# Altium schematic sheet a0206-2006.10.SchDoc
size 558 x 431 mm
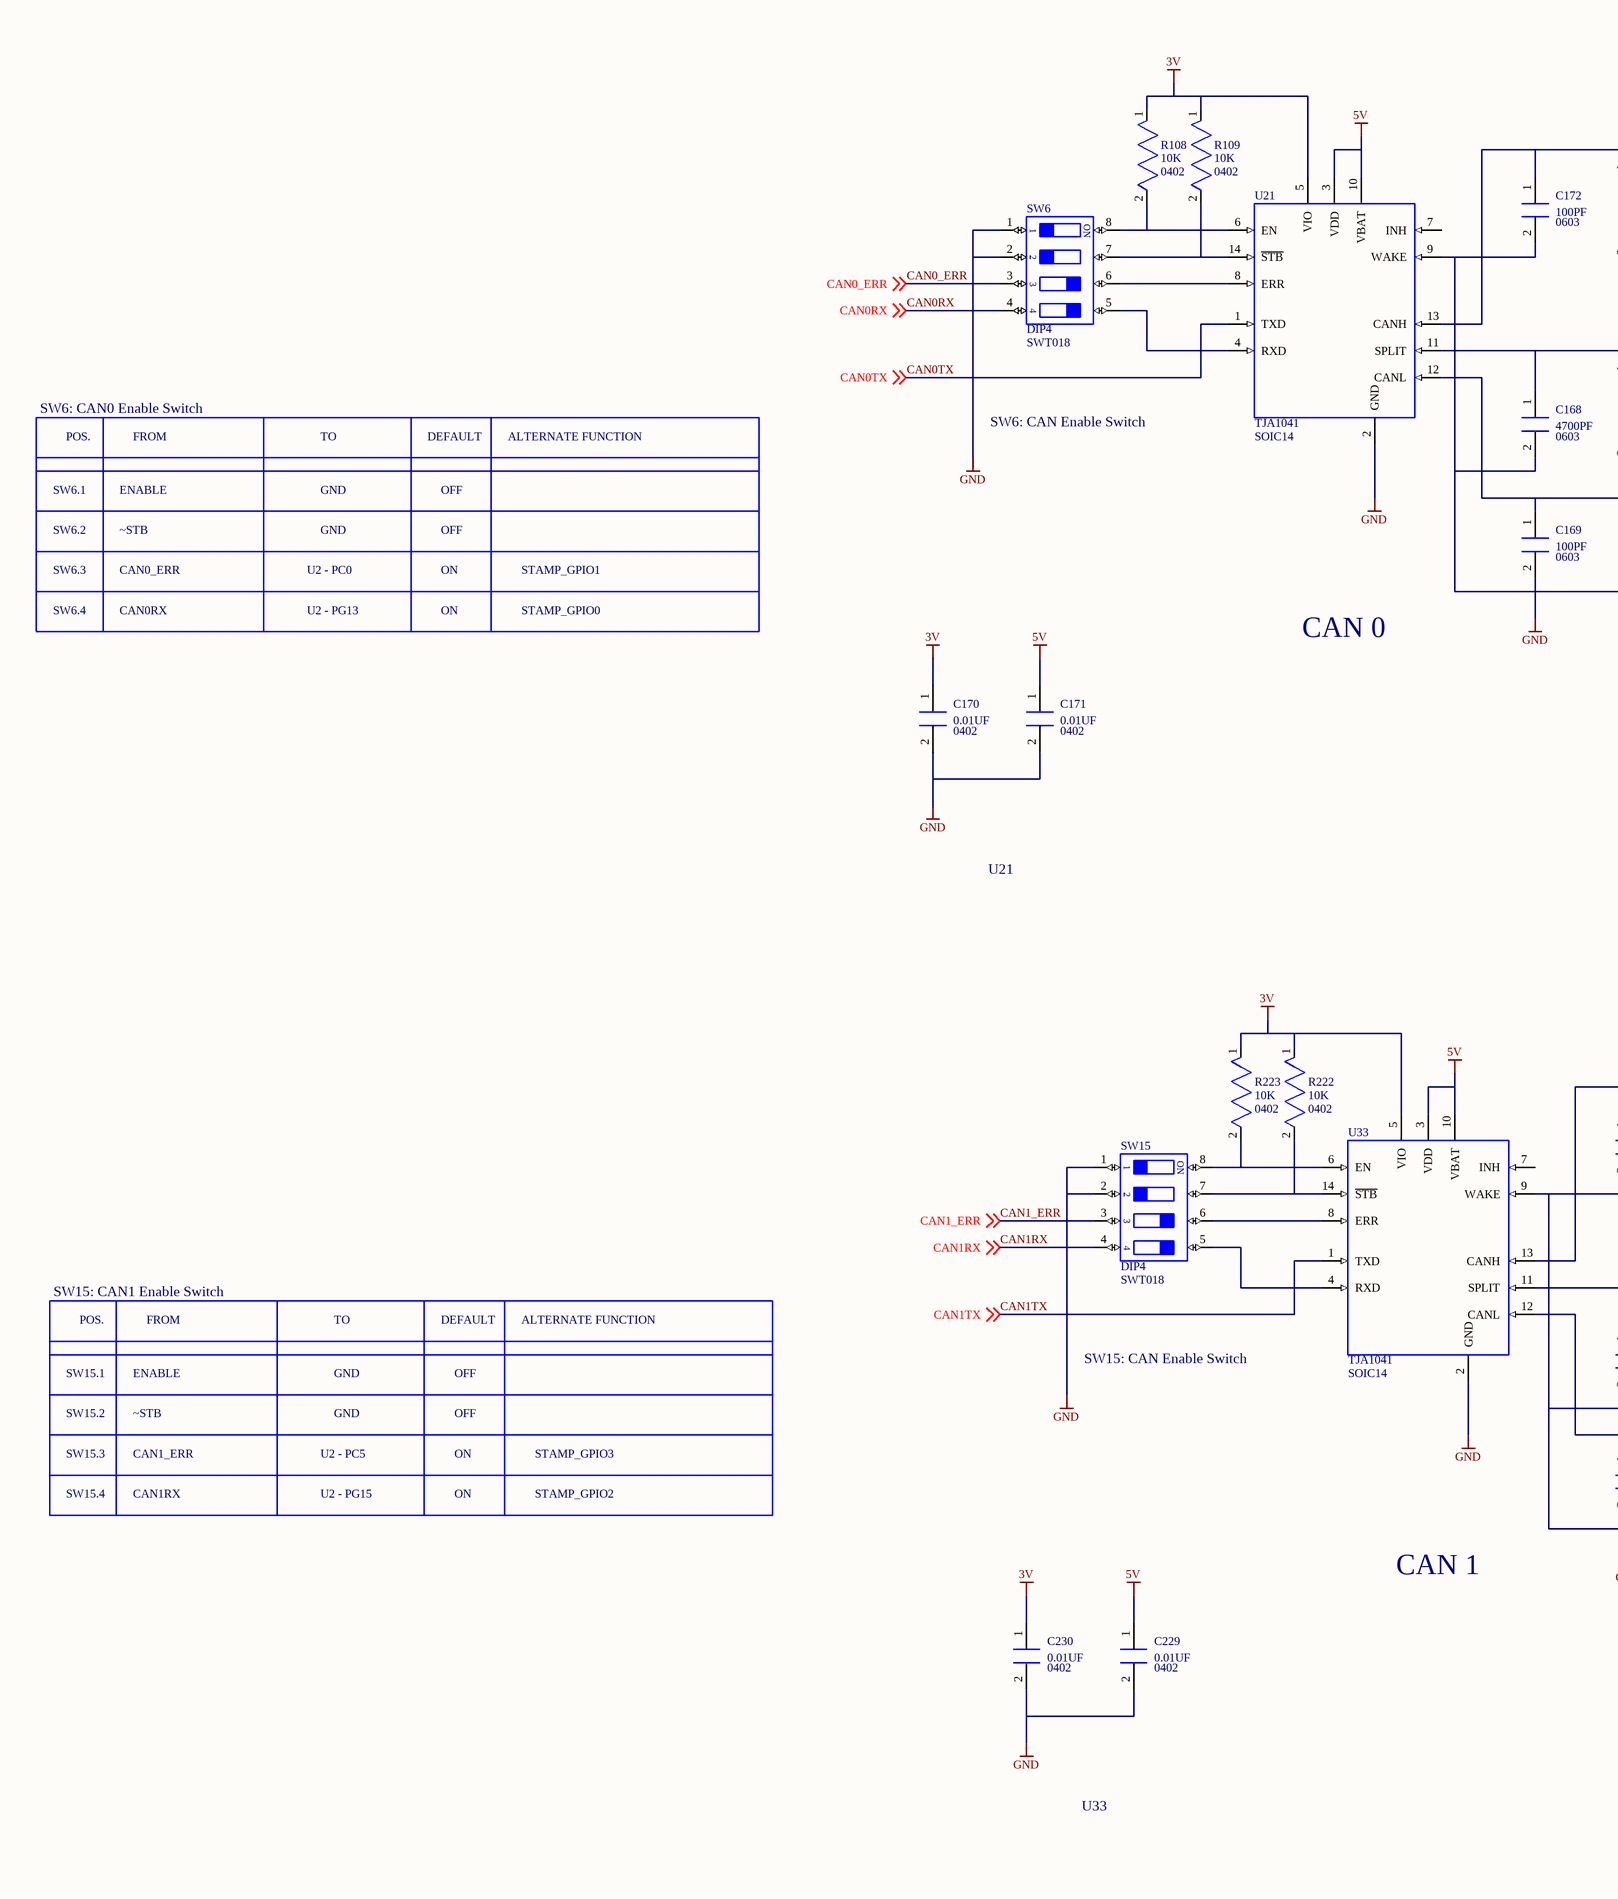
[diagram p0: a0206-2006.10.SchDoc, left]
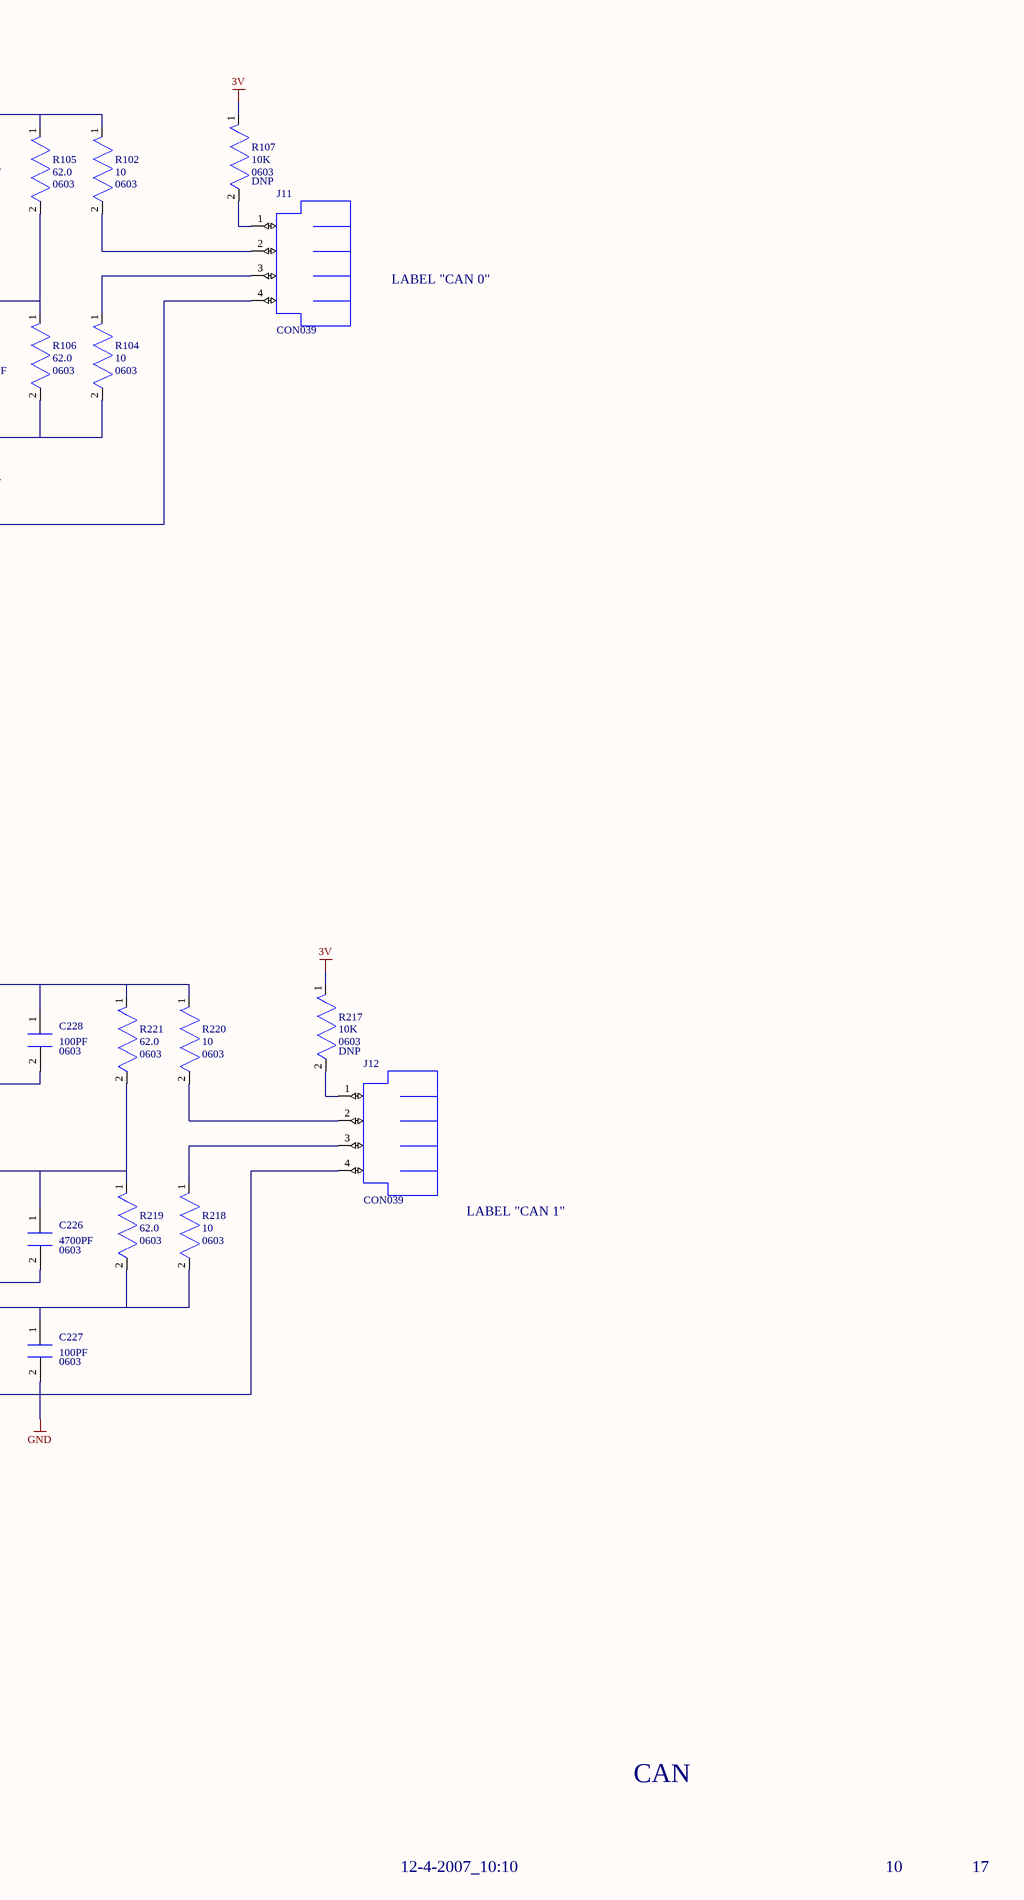
[diagram p1: a0206-2006.10.SchDoc, right]

## Parts
C168  value 4700PF  [0603]  (hidden comment: *)
C169  value 100PF  [0603]  (hidden comment: *)
C170  value 0.01UF  [0402]  (hidden comment: *)
C171  value 0.01UF  [0402]  (hidden comment: *)
C172  value 100PF  [0603]  (hidden comment: *)
C226  value 4700PF  [0603]  (hidden comment: *)
C227  value 100PF  [0603]  (hidden comment: *)
C228  value 100PF  [0603]  (hidden comment: *)
C229  value 0.01UF  [0402]  (hidden comment: *)
C230  value 0.01UF  [0402]  (hidden comment: *)
J11  *  [CON039]  (value not drawn)
J12  *  [CON039]  (value not drawn)
R102  value 10  [0603]  (hidden comment: *)
R104  value 10  [0603]  (hidden comment: *)
R105  value 62.0  [0603]  (hidden comment: *)
R106  value 62.0  [0603]  (hidden comment: *)
R107  value 10K  CLASS: DNP  [0603]  (hidden comment: *)
R108  value 10K  [0402]  (hidden comment: *)
R109  value 10K  [0402]  (hidden comment: *)
R217  value 10K  CLASS: DNP  [0603]  (hidden comment: *)
R218  value 10  [0603]  (hidden comment: *)
R219  value 62.0  [0603]  (hidden comment: *)
R220  value 10  [0603]  (hidden comment: *)
R221  value 62.0  [0603]  (hidden comment: *)
R222  value 10K  [0402]  (hidden comment: *)
R223  value 10K  [0402]  (hidden comment: *)
SW6  value DIP4  [SWT018]  (hidden comment: *)
SW15  value DIP4  [SWT018]  (hidden comment: *)
U21  PART: TJA1041  [SOIC14]  (hidden comment: *)
U33  PART: TJA1041  [SOIC14]  (hidden comment: *)

## Nets
3V: C170.1(A) C230.1(A) R107.1(N1) R108.1(N1) R109.1(N1) R217.1(N1) R222.1(N1) R223.1(N1) U21.5(VIO) U33.5(VIO)
5V: C171.1(A) C229.1(A) U21.3(VDD) U21.10(VBAT) U33.3(VDD) U33.10(VBAT)
GND: C168.2(B) C169.2(B) C170.2(B) C171.2(B) C172.2(B) C226.2(B) C227.2(B) C228.2(B) C229.2(B) C230.2(B) J11.4 J12.4 SW6.1 SW6.2 SW15.1 SW15.2 U21.2(GND) U21.9(WAKE) U33.2(GND) U33.9(WAKE)
CAN0_ERR: SW6.3 ; off-sheet CAN0_ERR
CAN0RX: SW6.4 ; off-sheet CAN0RX
CAN0TX: U21.1(TXD) ; off-sheet CAN0TX
CAN1_ERR: SW15.3 ; off-sheet CAN1_ERR
CAN1RX: SW15.4 ; off-sheet CAN1RX
CAN1TX: U33.1(TXD) ; off-sheet CAN1TX
NetC168_1: C168.1(A) R105.2(N2) R106.1(N1) U21.11(SPLIT)
NetC169_1: C169.1(A) R104.2(N2) R106.2(N2) U21.12(CANL)
NetC172_1: C172.1(A) R102.1(N1) R105.1(N1) U21.13(CANH)
NetC226_1: C226.1(A) R219.1(N1) R221.2(N2) U33.11(SPLIT)
NetC227_1: C227.1(A) R218.2(N2) R219.2(N2) U33.12(CANL)
NetC228_1: C228.1(A) R220.1(N1) R221.1(N1) U33.13(CANH)
NetJ11_1: J11.1 R107.2(N2)
NetJ11_2: J11.2 R102.2(N2)
NetJ11_3: J11.3 R104.1(N1)
NetJ12_1: J12.1 R217.2(N2)
NetJ12_2: J12.2 R220.2(N2)
NetJ12_3: J12.3 R218.1(N1)
NetR108_2: R108.2(N2) SW6.8 U21.6(EN)
NetR109_2: R109.2(N2) SW6.7 U21.14(~{STB})
NetR222_2: R222.2(N2) SW15.7 U33.14(~{STB})
NetR223_2: R223.2(N2) SW15.8 U33.6(EN)
NetSW6_5: SW6.5 U21.4(RXD)
NetSW6_6: SW6.6 U21.8(ERR)
NetSW15_5: SW15.5 U33.4(RXD)
NetSW15_6: SW15.6 U33.8(ERR)

Not connected (* = marked no-connect by the designer): U21 7(INH); U33 7(INH)

## Notes on the sheet
- LABEL "CAN 0"
- SW6: CAN0 Enable Switch
- POS.
- FROM
- TO
- DEFAULT
- ALTERNATE FUNCTION
- SW6: CAN Enable Switch
- SW6.1
- ENABLE
- GND
- OFF
- SW6.2
- SW6.3
- ~STB
- CAN0_ERR
- U2 - PC0
- ON
- STAMP_GPIO1
- SW6.4
- CAN0RX
- U2 - PG13
- STAMP_GPIO0
- CAN 0
- U21
- SW15: CAN1 Enable Switch
- SW15.1
- SW15: CAN Enable Switch
- LABEL "CAN 1"
- SW15.2
- SW15.3
- CAN1_ERR
- U2 - PC5
- STAMP_GPIO3
- SW15.4
- CAN1RX
- U2 - PG15
- STAMP_GPIO2
- CAN 1
- U33
- CAN
- 12-4-2007_10:10
- 10
- 17
- A
- B
- C
- D
- 1
- 2
- 3
- 20 Cotton Road
- 4
- DEVICES
- ANALOG
- Nashua, NH 03063
- PH: 1-800-ANALOGD
- Title
- ADSP-BF548 EZ-KIT LITE
- Size
- Board No.
- A0206-2006
- Rev
- 1.4B
- Date
- Sheet
- of
- (in symbol SW_DIP4.1) ON

## Library data of the parts
C168 = CAP_NON_POLARIZED.2: PART_SPEC: CAPACITOR; LEVEL: STD; TYPE: X7R; PRT_NUM: 7000387; BOARDS: BOTH; VOLTAGE: 16V; TOLERANCE: 10%; PKG_TYPE: 0603; ROHS: ROHS
C169 C172 = CAP_NON_POLARIZED.2: PART_SPEC: CAPACITOR; LEVEL: STD; TYPE: NPO; BOARDS: BOTH; TOLERANCE: 5%; VOLTAGE: 50V; PRT_NUM: 7000405; PKG_TYPE: 0603; ROHS: ROHS
C170 = CAP_NON_POLARIZED.2: PART_SPEC: CAPACITOR; LEVEL: STD; TYPE: X7R; BOARDS: BOTH; PRT_NUM: 7000279; VOLTAGE: 16V; TOLERANCE: 10%; PKG_TYPE: 0402; ROHS: ROHS
C171 = CAP_NON_POLARIZED.2: PART_SPEC: CAPACITOR; LEVEL: STD; TYPE: X7R; BOARDS: BOTH; TOLERANCE: 10%; VOLTAGE: 16V; PRT_NUM: 7000279; PKG_TYPE: 0402; ROHS: ROHS
C226 = CAP_NON_POLARIZED.2: PART_SPEC: CAPACITOR; LEVEL: STD; TOLERANCE: 10%; VOLTAGE: 16V; BOARDS: BOTH; PRT_NUM: 7000387; TYPE: X7R; PKG_TYPE: 0603; ROHS: ROHS
C227 C228 = CAP_NON_POLARIZED.2: PART_SPEC: CAPACITOR; LEVEL: STD; PRT_NUM: 7000405; VOLTAGE: 50V; TOLERANCE: 5%; BOARDS: BOTH; TYPE: NPO; PKG_TYPE: 0603; ROHS: ROHS
C229 = CAP_NON_POLARIZED.2: PART_SPEC: CAPACITOR; LEVEL: STD; PRT_NUM: 7000279; VOLTAGE: 16V; TOLERANCE: 10%; BOARDS: BOTH; TYPE: X7R; PKG_TYPE: 0402; ROHS: ROHS
C230 = CAP_NON_POLARIZED.2: PART_SPEC: CAPACITOR; LEVEL: STD; TOLERANCE: 10%; VOLTAGE: 16V; PRT_NUM: 7000279; BOARDS: BOTH; TYPE: X7R; PKG_TYPE: 0402; ROHS: ROHS
J11 = CON_RJ10.1: VERTICAL; LEVEL: STD; CONFIGURATION: 4PIN; PRT_NUM: 6000762; BOARDS: BOTH; TYPE: RJ11; PKG_TYPE: CON039; ROHS: ROHS
J12 = CON_RJ10.1: VERTICAL; LEVEL: STD; BOARDS: BOTH; PRT_NUM: 6000762; CONFIGURATION: 4PIN; TYPE: RJ11; PKG_TYPE: CON039; ROHS: ROHS
R102 = RES_STANDARD.2: PART_SPEC: RESISTOR; LEVEL: STD; POWER: 1/10W; BOARDS: BOTH; TOLERANCE: 5%; PRT_NUM: 7000374; PKG_TYPE: 0603; ROHS: ROHS
R104 = RES_STANDARD.2: PART_SPEC: RESISTOR; LEVEL: STD; POWER: 1/10W; BOARDS: BOTH; PRT_NUM: 7000374; TOLERANCE: 5%; PKG_TYPE: 0603; ROHS: ROHS
R105 R106 = RES_STANDARD.2: PART_SPEC: RESISTOR; LEVEL: STD; POWER: 1/10W; PRT_NUM: 7000411; BOARDS: BOTH; TOLERANCE: 1%; PKG_TYPE: 0603; ROHS: ROHS
R107 = RES_STANDARD.2: PART_SPEC: RESISTOR; LEVEL: STD; POWER: 1/10W; PRT_NUM: 7000364; BOARDS: BOTH; TOLERANCE: 5%; PKG_TYPE: 0603; ROHS: ROHS
R108 = RES_STANDARD.2: PART_SPEC: RESISTOR; LEVEL: STD; POWER: 1/16W; BOARDS: BOTH; TOLERANCE: 5%; PRT_NUM: 7000280; PKG_TYPE: 0402; ROHS: ROHS
R109 = RES_STANDARD.2: PART_SPEC: RESISTOR; LEVEL: STD; POWER: 1/16W; BOARDS: BOTH; PRT_NUM: 7000280; TOLERANCE: 5%; PKG_TYPE: 0402; ROHS: ROHS
R217 = RES_STANDARD.2: PART_SPEC: RESISTOR; LEVEL: STD; TOLERANCE: 5%; BOARDS: BOTH; PRT_NUM: 7000364; POWER: 1/10W; PKG_TYPE: 0603; ROHS: ROHS
R218 = RES_STANDARD.2: PART_SPEC: RESISTOR; LEVEL: STD; TOLERANCE: 5%; PRT_NUM: 7000374; BOARDS: BOTH; POWER: 1/10W; PKG_TYPE: 0603; ROHS: ROHS
R219 R221 = RES_STANDARD.2: PART_SPEC: RESISTOR; LEVEL: STD; TOLERANCE: 1%; BOARDS: BOTH; PRT_NUM: 7000411; POWER: 1/10W; PKG_TYPE: 0603; ROHS: ROHS
R220 = RES_STANDARD.2: PART_SPEC: RESISTOR; LEVEL: STD; PRT_NUM: 7000374; TOLERANCE: 5%; BOARDS: BOTH; POWER: 1/10W; PKG_TYPE: 0603; ROHS: ROHS
R222 = RES_STANDARD.2: PART_SPEC: RESISTOR; LEVEL: STD; TOLERANCE: 5%; PRT_NUM: 7000280; BOARDS: BOTH; POWER: 1/16W; PKG_TYPE: 0402; ROHS: ROHS
R223 = RES_STANDARD.2: PART_SPEC: RESISTOR; LEVEL: STD; PRT_NUM: 7000280; TOLERANCE: 5%; BOARDS: BOTH; POWER: 1/16W; PKG_TYPE: 0402; ROHS: ROHS
SW6 = SW_DIP4.1: 4PIN-SMT-SWT; PART_SPEC: SWITCH; LEVEL: STD; BOARDS: BOTH; PRT_NUM: 6000144; PKG_TYPE: SWT018; ROHS: ROHS
SW15 = SW_DIP4.1: 4PIN-SMT-SWT; PART_SPEC: SWITCH; LEVEL: STD; PRT_NUM: 6000144; BOARDS: BOTH; PKG_TYPE: SWT018; ROHS: ROHS
U21 = ICS_TJA1041.1: CAN-TRANSCEIVER; LEVEL: STD; PRT_NUM: 1000312; BOARDS: BOTH; PKG_TYPE: SOIC14; ROHS: ROHS; WEB: http://www.semiconductors.philips.com/pip/TJA1041T_N1.html
U33 = ICS_TJA1041.1: CAN-TRANSCEIVER; LEVEL: STD; BOARDS: BOTH; PRT_NUM: 1000312; PKG_TYPE: SOIC14; WEB: http://www.semiconductors.philips.com/pip/TJA1041T_N1.html; ROHS: ROHS